# Altium project MVP-Dash-v1.0.PrjPcb (part 12 of 15)

## Sheet Type-C-Sheet.SchDoc
size 420 x 297 mm; SheetNumber: 22; SheetTotal: 25
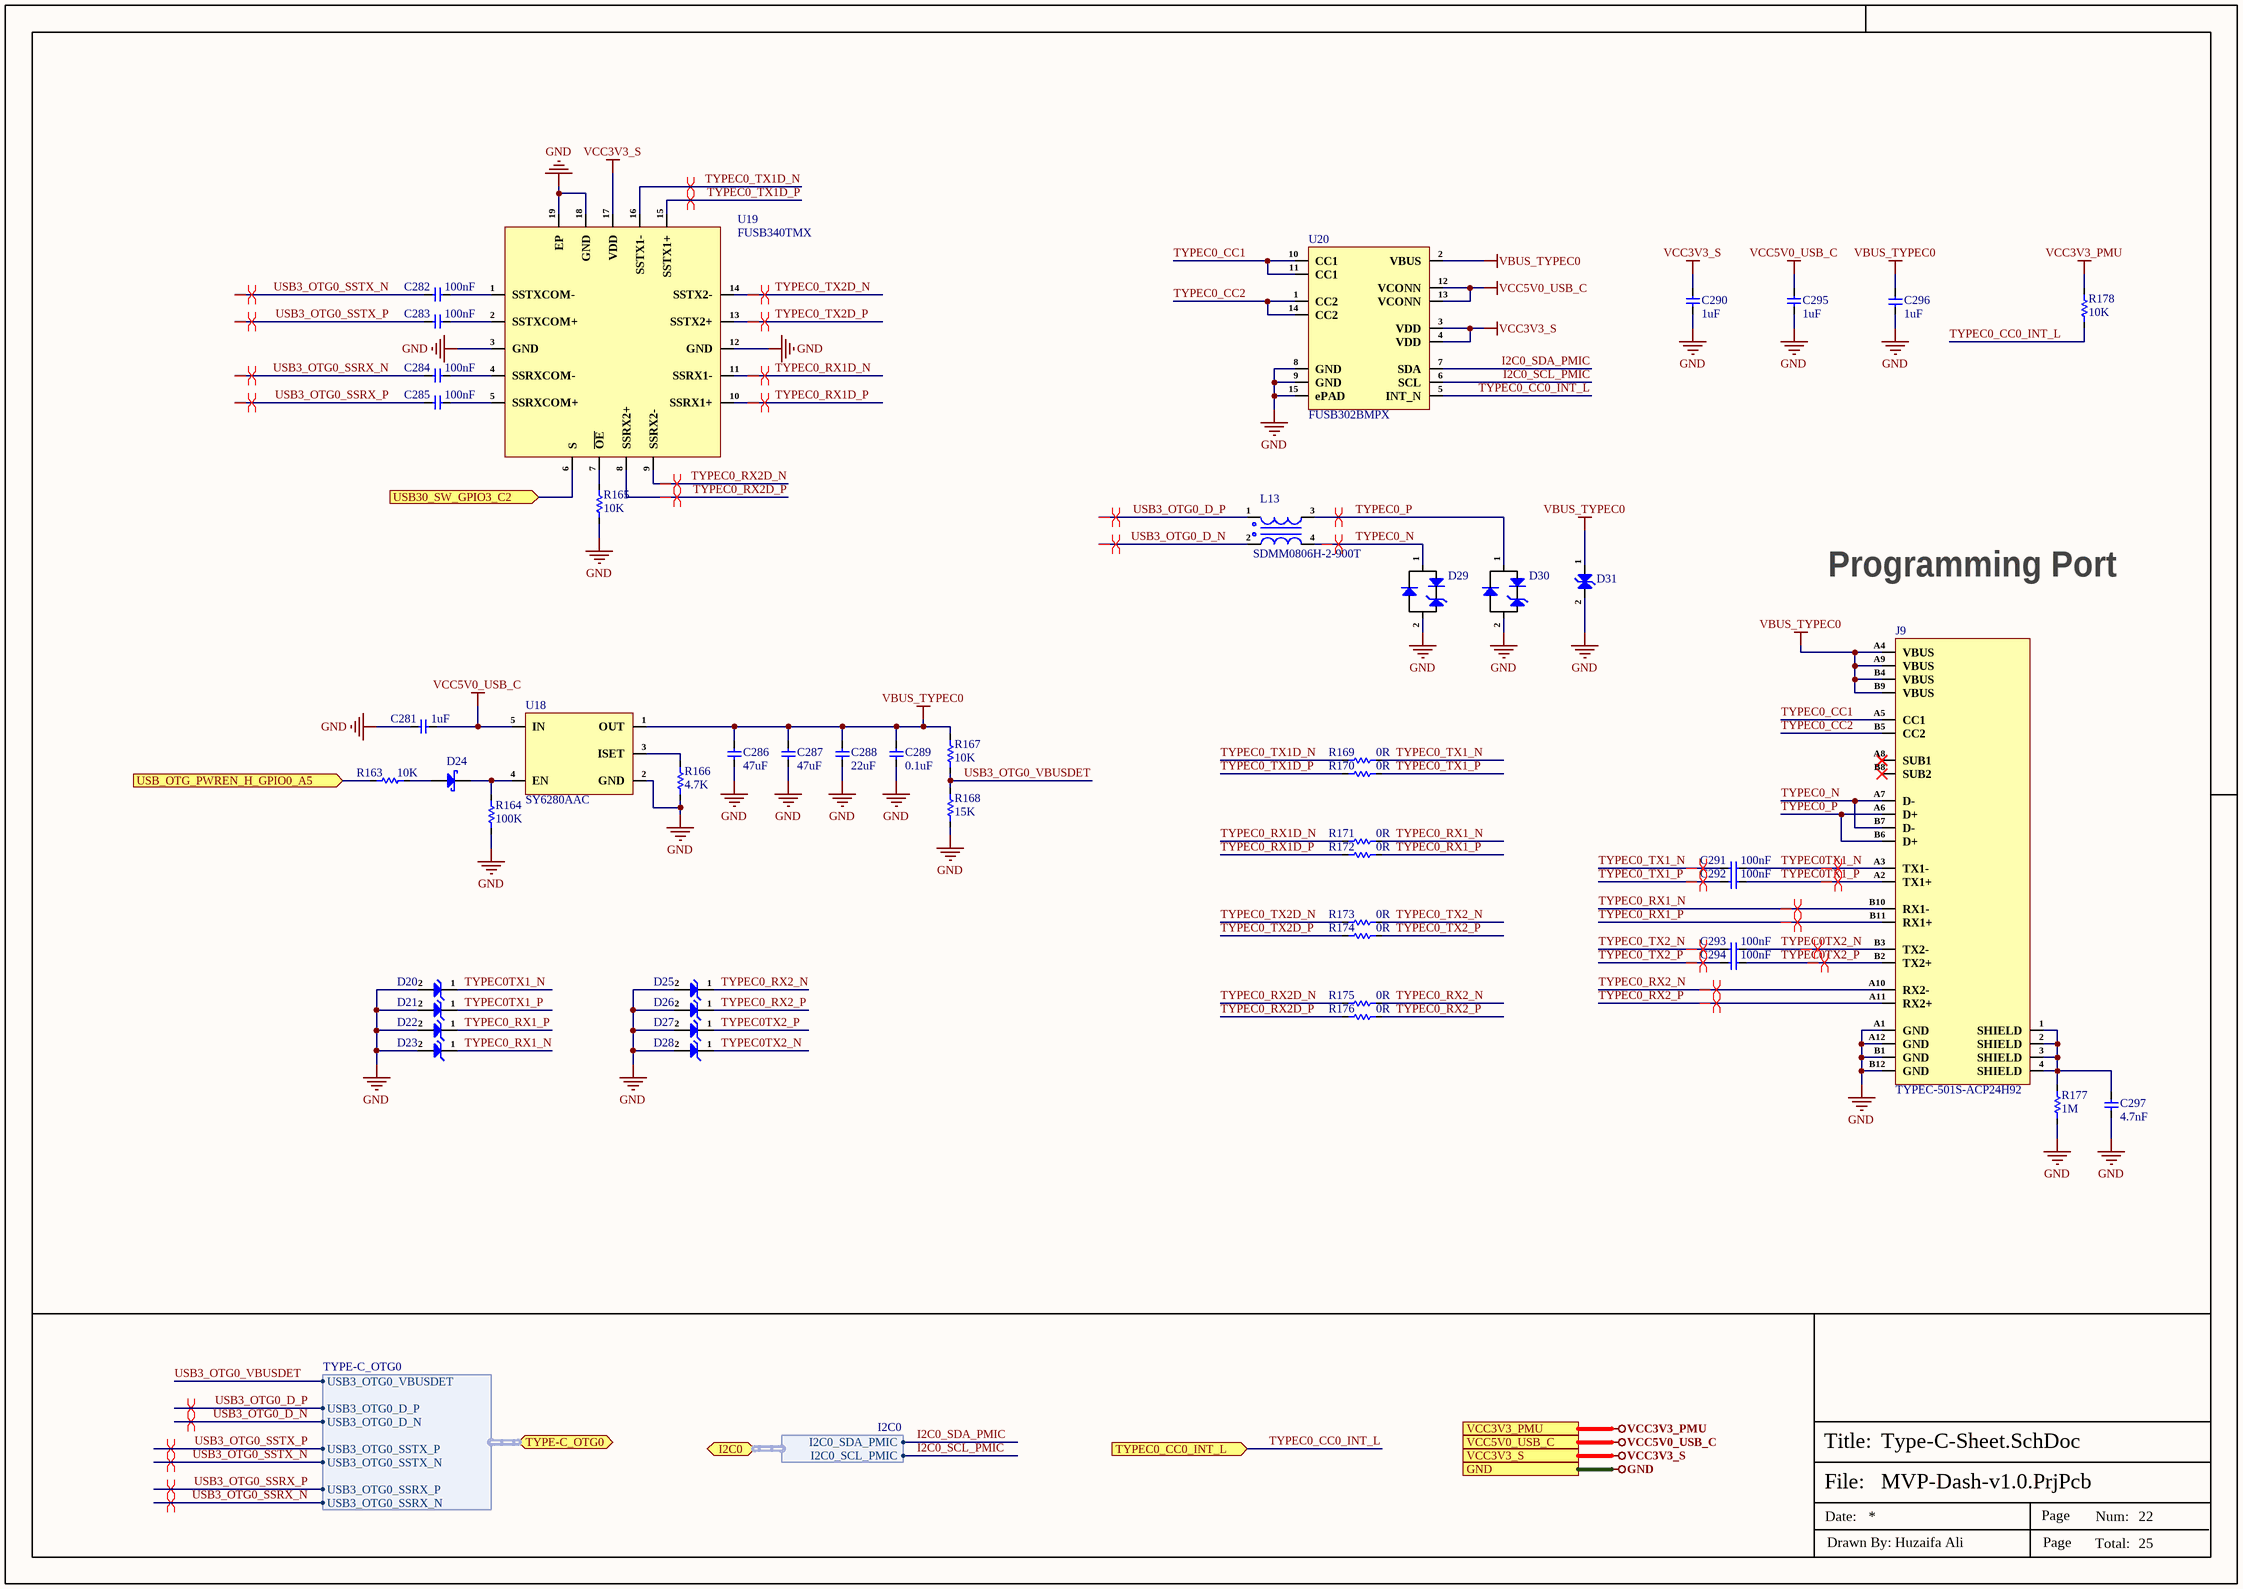
[diagram p29: Type-C-Sheet.SchDoc]

### Parts
C281  1uF  [Cap-0402]
C282  100nF  [CAP-0201]
C283  100nF  [CAP-0201]
C284  100nF  [CAP-0201]
C285  100nF  [CAP-0201]
C286  47uF  [Cap-1206]
C287  47uF  [Cap-1206]
C288  22uF  [Cap-0603]
C289  0.1uF  [Cap-0402]
C290  1uF  [Cap-0402]
C291  100nF  [CAP-0201]
C292  100nF  [CAP-0201]
C293  100nF  [CAP-0201]
C294  100nF  [CAP-0201]
C295  1uF  [Cap-0402]
C296  1uF  [Cap-0603]
C297  4.7nF  [Cap-1206]
D20  ESD5311Z-2/TR  [DFN0603-D]  (value not drawn)
D21  ESD5311Z-2/TR  [DFN0603-D]  (value not drawn)
D22  ESD5311Z-2/TR  [DFN0603-D]  (value not drawn)
D23  ESD5311Z-2/TR  [DFN0603-D]  (value not drawn)
D24  1N5819HW-7-F  [SOD-123]  (value not drawn)
D25  ESD5311Z-2/TR  [DFN0603-D]  (value not drawn)
D26  ESD5311Z-2/TR  [DFN0603-D]  (value not drawn)
D27  ESD5311Z-2/TR  [DFN0603-D]  (value not drawn)
D28  ESD5311Z-2/TR  [DFN0603-D]  (value not drawn)
D29  ESD5341N-2/TR  [DFN1006-2L_]  (value not drawn)
D30  ESD5341N-2/TR  [DFN1006-2L_]  (value not drawn)
D31  ESD5451N  [DFN1006-2L (Bi-Directional)]  (value not drawn)
J9  TYPEC-501S-ACP24H92  [TYPEC-501S-ACP24H92]
L13  SDMM0806H-2-900T  [0302]
R163  10K  [Res-0402]
R164  100K  [Res-0402]
R165  10K  [Res-0402]
R166  4.7K  [Res-0402]
R167  10K  [Res-0402]
R168  15K  [Res-0402]
R169  0R  [Res-0201]
R170  0R  [Res-0201]
R171  0R  [Res-0201]
R172  0R  [Res-0201]
R173  0R  [Res-0201]
R174  0R  [Res-0201]
R175  0R  [Res-0201]
R176  0R  [Res-0201]
R177  1M  [Res-0603]
R178  10K  [Res-0402]
U18  SY6280AAC  [SOT-23-5]
U19  FUSB340TMX  [X2-QFN-18]
U20  FUSB302BMPX  [WFQFN-14(2.5x2.5)]

### Ports
GND (see CAN-Bus-SPI-Flash-Sheet[4D], Connector-Sheet[5D], DRAM-LPDDR4x-Sheet[4D], eMMC-Sheet[4D], LED-Debug-Sheet[4D], Power-DC-IN-Sheet[4D], Power-Others-Sheet[4D], Power-PMIC-Sheet[4D], RK3568-Audio-Interface[4D], RK3568-Flash-SD-Controller[4D], RK3568-OSC-PMUIO-Sheet[5D], RK3568-Power-Sheet[4D], RK3568-SARADC-GPIO[4D], RK3568-USB-PCIe-Sheet[5D], RK3568-VI-Interface-Sheet[4D], RK3568-VO-Interface-1[4D], RK3568-VO-Interface-2[4D], Sensors-Sheet-1[4D], Sensors-Sheet-2[5D], USB-Ports[4D], VO-HDMI2.0-TX-Sheet[4D], VO-LCM-MIPI-DSI-TX0[4D], WIFI-BT-SDIO-Sheet[4D]), I2C0 (bidir, harness I2C0, see Power-Others-Sheet[3D], Power-PMIC-Sheet[2D], RK3568-OSC-PMUIO-Sheet[3D]), TYPE-C_OTG0 (bidir, harness TYPE-C_OTG0, see RK3568-USB-PCIe-Sheet[2D]), TYPEC0_CC0_INT_L (in, see RK3568-OSC-PMUIO-Sheet[5B]), USB30_SW_GPIO3_C2 (in, see RK3568-VO-Interface-2[3C]), USB_OTG_PWREN_H_GPIO0_A5 (in, see RK3568-OSC-PMUIO-Sheet[5B]), VCC3V3_PMU (see Power-Others-Sheet[4D], Power-PMIC-Sheet[4D], RK3568-OSC-PMUIO-Sheet[5D]), VCC3V3_S (see LED-Debug-Sheet[4D], Power-DC-IN-Sheet[4D], Sensors-Sheet-1[4D], Sensors-Sheet-2[5D], VO-LCM-MIPI-DSI-TX0[4D], WIFI-BT-SDIO-Sheet[4D]), VCC5V0_USB_C (see Power-DC-IN-Sheet[4D])

### Harnesses
TYPE-C_OTG0: USB3_OTG0_D_P, USB3_OTG0_D_N, USB3_OTG0_VBUSDET, USB3_OTG0_SSTX_P, USB3_OTG0_SSTX_N, USB3_OTG0_SSRX_P, USB3_OTG0_SSRX_N
I2C0: I2C0_SDA_PMIC, I2C0_SCL_PMIC

### Nets
GND: C281.1 C286.1 C287.1 C288.1 C289.1 C290.2 C295.2 C296.1 C297.1 D20.2(A) D21.2(A) D22.2(A) D23.2(A) D25.2(A) D26.2(A) D27.2(A) D28.2(A) D29.2(A) D30.2(A) D31.2(K) J9.A1(GND) J9.A12(GND) J9.B1(GND) J9.B12(GND) R164.2 R165.1 R166.1 R168.1 R177.1 U18.2(GND) U19.3(GND) U19.12(GND) U19.18(GND) U19.19(EP) U20.8(GND) U20.9(GND) U20.15(ePAD) ; port GND
VBUS_TYPEC0: C286.2 C287.2 C288.2 C289.2 C296.2 D31.1(K) J9.A4(VBUS) J9.A9(VBUS) J9.B4(VBUS) J9.B9(VBUS) R167.1 U18.1(OUT) U20.2(VBUS)
VCC3V3_PMU: R178.2 ; port VCC3V3_PMU
VCC3V3_S: C290.1 U19.17(VDD) U20.3(VDD) U20.4(VDD) ; port VCC3V3_S
VCC5V0_USB_C: C281.2 C295.1 U18.5(IN) U20.12(VCONN) U20.13(VCONN) ; port VCC5V0_USB_C
I2C0_SCL_PMIC: U20.6(SCL) ; port I2C0.I2C0_SCL_PMIC
I2C0_SDA_PMIC: U20.7(SDA) ; port I2C0.I2C0_SDA_PMIC
TYPEC0_CC0_INT_L: R178.1 U20.5(INT_N) ; port TYPEC0_CC0_INT_L
TYPEC0_CC1: J9.A5(CC1) U20.10(CC1) U20.11(CC1)
TYPEC0_CC2: J9.B5(CC2) U20.1(CC2) U20.14(CC2)
TYPEC0_N: D29.1(K) J9.A7(D-) J9.B7(D-) L13.4
TYPEC0_P: D30.1(K) J9.A6(D+) J9.B6(D+) L13.3
TYPEC0_RX1_N: D23.1(K) J9.B10(RX1-) R171.2
TYPEC0_RX1_P: D22.1(K) J9.B11(RX1+) R172.2
TYPEC0_RX1D_N: R171.1 U19.11(SSRX1-)
TYPEC0_RX1D_P: R172.1 U19.10(SSRX1+)
TYPEC0_RX2_N: D25.1(K) J9.A10(RX2-) R175.2
TYPEC0_RX2_P: D26.1(K) J9.A11(RX2+) R176.2
TYPEC0_RX2D_N: R175.1 U19.9(SSRX2-)
TYPEC0_RX2D_P: R176.1 U19.8(SSRX2+)
TYPEC0_TX1_N: C291.2 R169.2
TYPEC0_TX1_P: C292.2 R170.2
TYPEC0_TX1D_N: R169.1 U19.16(SSTX1-)
TYPEC0_TX1D_P: R170.1 U19.15(SSTX1+)
TYPEC0_TX2_N: C293.2 R173.2
TYPEC0_TX2_P: C294.2 R174.2
TYPEC0_TX2D_N: R173.1 U19.14(SSTX2-)
TYPEC0_TX2D_P: R174.1 U19.13(SSTX2+)
TYPEC0TX1_N: C291.1 D20.1(K) J9.A3(TX1-)
TYPEC0TX1_P: C292.1 D21.1(K) J9.A2(TX1+)
TYPEC0TX2_N: C293.1 D28.1(K) J9.B3(TX2-)
TYPEC0TX2_P: C294.1 D27.1(K) J9.B2(TX2+)
USB3_OTG0_D_N: L13.2 ; port TYPE-C_OTG0.USB3_OTG0_D_N
USB3_OTG0_D_P: L13.1 ; port TYPE-C_OTG0.USB3_OTG0_D_P
USB3_OTG0_SSRX_N: C284.2 ; port TYPE-C_OTG0.USB3_OTG0_SSRX_N
USB3_OTG0_SSRX_P: C285.2 ; port TYPE-C_OTG0.USB3_OTG0_SSRX_P
USB3_OTG0_SSTX_N: C282.2 ; port TYPE-C_OTG0.USB3_OTG0_SSTX_N
USB3_OTG0_SSTX_P: C283.2 ; port TYPE-C_OTG0.USB3_OTG0_SSTX_P
USB3_OTG0_VBUSDET: R167.2 R168.2 ; port TYPE-C_OTG0.USB3_OTG0_VBUSDET
NetC282_1: C282.1 U19.1(SSTXCOM-)
NetC283_1: C283.1 U19.2(SSTXCOM+)
NetC284_1: C284.1 U19.4(SSRXCOM-)
NetC285_1: C285.1 U19.5(SSRXCOM+)
NetC297_2: C297.2 J9.1(SHIELD) J9.2(SHIELD) J9.3(SHIELD) J9.4(SHIELD) R177.2
NetD24_1: D24.1(A) R163.1
NetD24_2: D24.2(K) R164.1 U18.4(EN)
NetR163_2: R163.2 ; port USB_OTG_PWREN_H_GPIO0_A5
NetR165_2: R165.2 U19.7(~{OE})
NetR166_2: R166.2 U18.3(ISET)
NetU8_AA7: U19.6(S) ; port USB30_SW_GPIO3_C2

Not connected (* = marked no-connect by the designer): J9 A8(SUB1)* B8(SUB2)*

### Layout directives
differential pair: TYPEC0_TX1D_N, TYPEC0_TX1D_P, USB3_OTG0_D_N, USB3_OTG0_D_P, USB3_OTG0_SSRX_N, USB3_OTG0_SSRX_P, USB3_OTG0_SSTX_N, USB3_OTG0_SSTX_P
differential pair; differential pair class USB: TYPEC0_N, TYPEC0_P, TYPEC0_RX1_N, TYPEC0_RX1_P, TYPEC0_RX1D_N, TYPEC0_RX1D_P, TYPEC0_RX2_N, TYPEC0_RX2_P, TYPEC0_RX2D_N, TYPEC0_RX2D_P, TYPEC0_TX1_N, TYPEC0_TX1_P, TYPEC0_TX2_N, TYPEC0_TX2_P, TYPEC0_TX2D_N, TYPEC0_TX2D_P, TYPEC0TX1_N, TYPEC0TX1_P, TYPEC0TX2_N, TYPEC0TX2_P, USB3_OTG0_D_N, USB3_OTG0_D_P, USB3_OTG0_SSRX_N, USB3_OTG0_SSRX_P, USB3_OTG0_SSTX_N, USB3_OTG0_SSTX_P

### Notes on the sheet
- Programming Port
- File:
- Title:
- Date:
- Page
- Num:
- Total:
- Drawn By: Huzaifa Ali

### Library data of the parts
C281 C290 C295 = CC0402KRX5R6BB105: CAP CER 1UF 10V X5R 0402; Manufacturer: Yageo; Tolerance: 10%; Dissipation Factor: 15%; Item Type: Capacitor; Supplier 1: Mouser; Manufacturer Part Number: CC0402KRX5R6BB105; RoHS: Yes; Category: Ceramic Capacitors; Stock 1: 6711367; Pricing 1: 1=0.11000, 10=0.05500, 50=0.05500, 100=0.03300, 500=0.02700, 1000=0.02200, 2500=0.02100, 10000=0.01800 (USD); Mount: Surface Mount; Case/Package: 0402; Number of Pins: 2; Case Code (Metric): 1005; Case Code (Imperial): 0402; Min Operating Temperature: -55°C; Max Operating Temperature: 85°C; Capacitance: 1uF; Dielectric: X5R; Package Quantity: 1; Voltage Rating: 10V; Packaging: Tape and Reel; Voltage Rating (DC): 10V; Termination: SMD/SMT; Resistor Type: Ceramic; Series: CC; Construction: Flat; Length: 1mm; Width: 0.02inch; Height: 0.5mm; Thickness: 0.022inch; Depth: 0.5mm; Radiation Hardening: No; REACH SVHC: No SVHC; Lead Free: Lead Free; Halogen Free: Halogen Free; RoHS Compliant: Yes; ComponentLink1URL: https://datasheet.ciiva.com/176/upy-gphc-x5r-4v-to-50v-12-176704.pdf?src-supplier=Digi-Key; ComponentLink1Description: https://datasheet.ciiva.com/176/upy-gphc-x5r-4v-to-50v-12-176704.pdf?src-supplier=Digi-Key; ComponentLink2URL: https://datasheet.ciiva.com/176/mlccorderingcode-176705.pdf?src-supplier=Digi-Key; ComponentLink2Description: https://datasheet.ciiva.com/176/mlccorderingcode-176705.pdf?src-supplier=Digi-Key; ComponentLink3URL: https://datasheet.ciiva.com/176/mlccorderingcode-176706.pdf?src-supplier=Digi-Key; ComponentLink3Description: https://datasheet.ciiva.com/176/mlccorderingcode-176706.pdf?src-supplier=Digi-Key; Supplier Part Number 1: 603-CC402KRX5R6BB105; LCSC Part Number: C106254
C282-C285 C291-C294 = CC0201KRX5R6BB104: CAP CER 0.1UF 10V X5R 0201; Manufacturer: Yageo; Tolerance: 10%; Supplier 1: Mouser; Manufacturer Part Number: CC0201KRX5R6BB104; RoHS: Yes; Category: Ceramic Capacitors; Stock 1: 824403; Pricing 1: 1=0.10000, 10=0.02400, 50=0.02400, 100=0.01900, 1000=0.01100, 10000=0.00900 (USD); Mount: Surface Mount; Case/Package: 0201; Case Code (Imperial): 0201; Case Code (Metric): 0603; Weight: 6E-06oz; Min Operating Temperature: -55°C; Max Operating Temperature: 85°C; Capacitance: 100nF; Dielectric: X5R; Voltage Rating (DC): 10V; Packaging: Tape and Reel; Termination: SMD/SMT; Resistor Type: Ceramic; Voltage Rating: 10V; Series: CC; Construction: Flat; Length: 0.6mm; Width: 0.012inch; Height: 0.3mm; Thickness: 0.013inch; Depth: 0.3mm; Radiation Hardening: No; Lead Free: Lead Free; Halogen Free: Halogen Free; RoHS Compliant: Yes; ComponentLink1URL: https://datasheet.ciiva.com/11587/upy-gphc-x5r-4v-to-50v-12-11587190.pdf?src-supplier=Avnet; ComponentLink1Description: https://datasheet.ciiva.com/11587/upy-gphc-x5r-4v-to-50v-12-11587190.pdf?src-supplier=Avnet; Supplier Part Number 1: 603-CC201KRX5R6BB104; LCSC Part Number: C190183
C286 C287 = GRM31CR61E476ME44L: CAP CER 47UF 25V X5R 1206; Manufacturer: Murata; Tolerance: 20%; Item Type: Capacitor; Supplier 1: Digi-Key; Manufacturer Part Number: GRM31CR61E476ME44L; RoHS: Yes; Category: Ceramic Capacitors; Capacitance: 47uF; Voltage Rating (DC): 25V; Dielectric: X5R; Length: 3.2mm; Width: 1.6mm; Thickness: 1.6mm; ComponentLink1URL: https://search.murata.co.jp/Ceramy/image/img/A01X/partnumbering_e_01.pdf?src-supplier=Digi-Key; ComponentLink1Description: https://search.murata.co.jp/Ceramy/image/img/A01X/partnumbering_e_01.pdf?src-supplier=Digi-Key; Supplier Part Number 1: 490-16268-2-ND; LCSC Part Number: C403725
C288 = CC0603MRX5R6BB226: CAP CER 22UF 10V X5R 0603; Manufacturer: Yageo; Tolerance: 20%; Item Type: Capacitor; Supplier 1: Digi-Key; Manufacturer Part Number: CC0603MRX5R6BB226; RoHS: Yes; Category: Ceramic Capacitors; Stock 1: 19628; Pricing 1: 1=0.68000, 10=0.48000, 50=0.36300, 100=0.31610, 500=0.23416, 1000=0.19903 (USD); Mount: Surface Mount; Case/Package: 0603; Case Code (Metric): 1608; Case Code (Imperial): 0603; Weight: 7.1E-05oz; Min Operating Temperature: -55°C; Max Operating Temperature: 85°C; Packaging: Tape and Reel; Capacitance: 22uF; Voltage Rating: 10V; Dielectric: X5R; Termination: SMD/SMT; Voltage Rating (DC): 10V; Package Quantity: 4000; Length: 0.063inch; Width: 0.8mm; Height: 0.8mm; Thickness: 0.035inch; Lead Free: Lead Free; Halogen Free: Halogen Free; RoHS Compliant: Yes; ComponentLink1URL: http://www.mouser.com/ds/2/447/Yageo_UPY-GP_NP0_16V-to-50V_9-358835.pdf?src-supplier=Mouser; ComponentLink1Description: http://www.mouser.com/ds/2/447/Yageo_UPY-GP_NP0_16V-to-50V_9-358835.pdf?src-supplier=Mouser; ComponentLink2URL: http://www.yageo.com/documents/recent/UPY-GPHC_X5R_4V-to-50V_25.pdf?src-supplier=Digi-Key; ComponentLink2Description: http://www.yageo.com/documents/recent/UPY-GPHC_X5R_4V-to-50V_25.pdf?src-supplier=Digi-Key; Supplier Part Number 1: 311-1819-1-ND; LCSC Part Number: C109447
C289 = CC0402KRX5R6BB104: CAP CER 0.1UF 10V X5R 0402; Manufacturer: Yageo; Capacitance: 100nF; Tolerance: 10%; Dissipation Factor: 5%; Insulation Resistance: 10GR; Item Type: Capacitor; Supplier 1: Digi-Key; Manufacturer Part Number: CC0402KRX5R6BB104; RoHS: Yes; Category: Ceramic Capacitors; Stock 1: 6385580; Pricing 1: 1=0.10000, 10=0.02700, 50=0.01500, 100=0.01220, 500=0.00874, 1000=0.00687, 2500=0.00625, 5000=0.00575 (USD); Mount: Surface Mount; Case/Package: 0402; Number of Pins: 2; Case Code (Imperial): 0402; Case Code (Metric): 1005; Min Operating Temperature: -55°C; Max Operating Temperature: 85°C; Dielectric: X5R; Packaging: Tape and Reel; Voltage Rating: 10V; Package Quantity: 1; Termination: SMD/SMT; Voltage Rating (DC): 10V; Series: CC; Length: 1mm; Width: 0.02inch; Height: 0.5mm; Depth: 0.5mm; Thickness: 0.022inch; Radiation Hardening: No; RoHS Compliant: Yes; REACH SVHC: No SVHC; Lead Free: Lead Free; Halogen Free: Halogen Free; ComponentLink1URL: https://datasheet.ciiva.com/144/mlccorderingcode-144029.pdf?src-supplier=Digi-Key; ComponentLink1Description: https://datasheet.ciiva.com/144/mlccorderingcode-144029.pdf?src-supplier=Digi-Key; ComponentLink2URL: https://datasheet.ciiva.com/144/mlccorderingcode-144028.pdf?src-supplier=Digi-Key; ComponentLink2Description: https://datasheet.ciiva.com/144/mlccorderingcode-144028.pdf?src-supplier=Digi-Key; ComponentLink3URL: https://datasheet.ciiva.com/144/mlccorderingcode-144030.pdf?src-supplier=Digi-Key; ComponentLink3Description: https://datasheet.ciiva.com/144/mlccorderingcode-144030.pdf?src-supplier=Digi-Key; ComponentLink4URL: https://datasheet.ciiva.com/7978/1359354-7978091.pdf?src-supplier=Element14; ComponentLink4Description: https://datasheet.ciiva.com/7978/1359354-7978091.pdf?src-supplier=Element14; ComponentLink5URL: https://datasheet.ciiva.com/11587/upy-gphc-x5r-4v-to-50v-12-11587302.pdf?src-supplier=Avnet; ComponentLink5Description: https://datasheet.ciiva.com/11587/upy-gphc-x5r-4v-to-50v-12-11587302.pdf?src-supplier=Avnet; Supplier Part Number 1: 311-1336-1-ND; LCSC Part Number: C129131
C296 = CL10A105KB8NNNC: CAP CER 1UF 50V X5R 0603; Manufacturer: Samsung; Material: 4241ConductorMaterial; Tolerance: 10%; Item Type: Capacitor; Supplier: Avnet; Supplier Part Number: CL10A105KB8NNNC; Manufacturer Part Number: CL10A105KB8NNNC; RoHS: Yes; Category: Ceramic Capacitors; Stock: 780446; Pricing: 4000=0.01632, 8000=0.01595, 16000=0.01557, 24000=0.0152, 32000=0.01482 (USD); Mounting Technology: Surface Mount; Case/Package: 0603; Case Code (Metric): 1608; Case Code (Imperial): 0603; Min Operating Temperature: -55°C; Max Operating Temperature: 85°C; Packaging: Tape and Reel; Value: 1uF; Voltage Rating: 50V; Dielectric: X5R; Series: CL; Voltage Rating (DC): 50V; Length: 1.6mm; Depth: 0.8mm; Radiation Hardening: No; RoHS Compliant: Yes; ComponentLink1URL: https://datasheet.ciiva.com/26877/getdatasheetpartid-753736-26877879.pdf?src-supplier=Verical; ComponentLink1Description: https://datasheet.ciiva.com/26877/getdatasheetpartid-753736-26877879.pdf?src-supplier=Verical; LCSC Part Number: C15849
C297 = CC1206KKX7RCBB472: CAP CER 4700PF 1KV X7R 1206; Manufacturer: Yageo; Dielectric Material: Ceramic; Tolerance: 10%; Item Type: Capacitor; Supplier 1: Future Electronics; Manufacturer Part Number: CC1206KKX7RCBB472; RoHS: Yes; Category: Ceramic Capacitors; Stock 1: 180000; Pricing 1: 3000=0.02860, 9000=0.02750, 15000=0.02700, 45000=0.02600, 75000=0.02510 (USD); Mount: Surface Mount; Case/Package: 1206; Number of Pins: 2; Case Code (Imperial): 1206; Case Code (Metric): 3216; Weight: 0.000571oz; Min Operating Temperature: -55°C; Max Operating Temperature: 125°C; Voltage Rating: 1kV; Capacitance: 4.7nF; Packaging: Tape and Reel; Voltage Rating (DC): 1kV; Dielectric: X7R; Termination: SMD/SMT; Resistor Type: Ceramic; Series: CC; Length: 3.2mm; Width: 0.063inch; Thickness: 0.057inch; Depth: 1.6mm; Radiation Hardening: No; Lead Free: Lead Free; RoHS Compliant: Yes; ComponentLink1URL: https://datasheet.ciiva.com/13208/upy-gp-np0-16v-to-50v-8-13208693.pdf?src-supplier=Mouser; ComponentLink1Description: https://datasheet.ciiva.com/13208/upy-gp-np0-16v-to-50v-8-13208693.pdf?src-supplier=Mouser; ComponentLink2URL: https://datasheet.ciiva.com/11466/hv-11466701.pdf?src-supplier=Avnet; ComponentLink2Description: https://datasheet.ciiva.com/11466/hv-11466701.pdf?src-supplier=Avnet; Supplier Part Number 1: 7130131; LCSC Part Number: C107198
D20-D23 D25-D28 = ESD5311Z-2/TR: DFN0603-D ESD Protection Devices ROHS; Manufacturer: WILLSEMI; Item Type: Diode; Manufacturer Part Number: ESD5311Z-2/TR; Package: DFN0603-D; LCSC Part Number: C239819; ComponentLink1Description: LCSC; ComponentLink1URL: https://www.lcsc.com/product-detail/ESD-Protection-Devices_WILLSEMI-Will-Semicon-ESD5311Z-2-TR_C239819.html
D24 = 1N5819HW-7-F: DIODE SCHOTTKY 40V 1A SOD123; Manufacturer: Diodes; Forward Voltage: 450mV; Max Reverse Current: 50uA; Element Configuration: Single; Max Forward Surge Current (Ifsm): 25A; Max Power Dissipation: 450mW; Polarity: Standard; Capacitance: 110pF; Supplier 1: Digi-Key; Manufacturer Part Number: 1N5819HW-7-F; RoHS: Yes; Category: Schottky Diodes; Pricing 1: 1=0.46000, 10=0.34500, 100=0.19530, 500=0.12936, 1000=0.09918 (USD); Case/Package: SOD-123-2; Number of Pins: 2; Weight: 0.000353oz; Contact Plating: Tin,Matte; Min Operating Temperature: -65°C; Max Operating Temperature: 125°C; Forward Current: 1A; Max Repetitive Reverse Voltage (Vrrm): 40V; Packaging: Tape and Reel; Peak Non-Repetitive Surge Current: 25A; Package Quantity: 3000; Average Rectified Current: 1A; Termination: SMD/SMT; Voltage Rating (DC): 40V; Current Rating: 1A; Output Current: 1A; Max Reverse Voltage (DC): 40V; Series: -; Length: 2.85mm; Width: 1.7mm; Height: 1.25mm; Radiation Hardening: No; RoHS Compliant: Yes; REACH SVHC: No SVHC; Lead Free: Lead Free; ComponentLink1URL: https://datasheet.ciiva.com/16303/ds30217-16303296.pdf?src-supplier=Future+Electronics; ComponentLink1Description: https://datasheet.ciiva.com/16303/ds30217-16303296.pdf?src-supplier=Future+Electronics; ComponentLink2URL: https://datasheet.ciiva.com/27092/1538419-27092484.pdf?src-supplier=Jameco; ComponentLink2Description: https://datasheet.ciiva.com/27092/1538419-27092484.pdf?src-supplier=Jameco; ComponentLink3URL: https://datasheet.ciiva.com/912/ds30217-912801.pdf?src-supplier=Digi-Key; ComponentLink3Description: https://datasheet.ciiva.com/912/ds30217-912801.pdf?src-supplier=Digi-Key; ComponentLink4URL: https://datasheet.ciiva.com/1177/ds30217-1177089.pdf?src-supplier=Element14; ComponentLink4Description: https://datasheet.ciiva.com/1177/ds30217-1177089.pdf?src-supplier=Element14; ComponentLink5URL: https://datasheet.ciiva.com/912/ds30217-912802.pdf?src-supplier=Digi-Key; ComponentLink5Description: https://datasheet.ciiva.com/912/ds30217-912802.pdf?src-supplier=Digi-Key; ComponentLink6URL: https://datasheet.ciiva.com/912/ds30217-912803.pdf?src-supplier=Digi-Key; ComponentLink6Description: https://datasheet.ciiva.com/912/ds30217-912803.pdf?src-supplier=Digi-Key; ComponentLink7URL: https://datasheet.ciiva.com/8303/ds30217-8303132.pdf?src-supplier=Avnet; ComponentLink7Description: https://datasheet.ciiva.com/8303/ds30217-8303132.pdf?src-supplier=Avnet; ComponentLink8URL: https://datasheet.ciiva.com/25919/ds30217-25919644.pdf?src-supplier=Avnet+Europe; ComponentLink8Description: https://datasheet.ciiva.com/25919/ds30217-25919644.pdf?src-supplier=Avnet+Europe; Supplier Part Number 1: 1N5819HW-FDICT-ND; LCSC Part Number: C82544; Item Type: Diode
D29 D30 = ESD5341N-2/TR: 4A@8/20us 15V 7V 5V Unidirectional DFN1006-2L TVS ROHS; Manufacturer: WILLSEMI; Item Type: Diode; Manufacturer Part Number: ESD5341N-2/TR; Package: DFN1006-2L; ComponentLink1Description: LCSC; ComponentLink1URL: https://www.lcsc.com/product-detail/TVS_WILLSEMI-Will-Semicon-ESD5341N-2-TR_C239773.html; LCSC Part Number: C239773
D31 = ESD5451N: DFN1006-2(0402) ESD Protection Devices ROHS; Manufacturer: TECH PUBLIC; Manufacturer Part Number: ESD5451N; Footprint: DFN1006-2(0402); ComponentLink1Description: LCSC; ComponentLink1URL: https://www.lcsc.com/product-detail/span-style-background-color-ff0-ESD-span-Protection-Devices_TECH-PUBLIC-ESD5451N_C2936977.html; LCSC Part Number: C2936977
J9 = TYPEC-501S-ACP24H92: 5A USB 3.1 1 260℃ Brick nogging 24P Female -45℃~+85℃ Type-C SMD USB Connectors ROHS; Manufacturer: XUNPU; Manufacturer Part Number: TYPEC-501S-ACP24H92; Package: SMD; LCSC Part Number: C2840394; Item Type: Type-C SMD USB Connector; ComponentLink1Description: LCSC; ComponentLink1URL: https://www.lcsc.com/product-detail/USB-Connectors_XUNPU-TYPEC-501S-ACP24H92_C2840394.html
L13 = SDMM0806H-2-900T: 90Ω@100MHz 4Ω 2 0302 Common Mode Filters ROHS; Manufacturer: Sunlord; Manufacturer Part Number: SDMM0806H-2-900T; Package: 0302; LCSC Part Number: C370285; Item Type: Common Mode Filter; ComponentLink1Description: LCSC; ComponentLink1URL: https://www.lcsc.com/product-detail/Common-Mode-Filters_Sunlord-SDMM0806H-2-900T_C370285.html
R163 R165 R167 R178 = RC0402FR-0710KL: RES 10K OHM 1% 1/16W 0402; Manufacturer: Yageo; Resistance: 10kR; Voltage Rating (DC): 50V; Temperature Coefficient: 100ppm/°C; Power Rating: 62.5mW; Max Power Dissipation: 63mW; Item Type: Resistor; Supplier 1: Mouser; Manufacturer Part Number: RC0402FR-0710KL; RoHS: Yes; Category: Chip SMD Resistors; Stock 1: 18648329; Pricing 1: 1=0.10000, 10=0.01400, 50=0.01400, 100=0.00500, 1000=0.00300, 10000=0.00200 (USD); Case/Package: 0402; Number of Pins: 2; Case Code (Imperial): 0402; Case Code (Metric): 1005; Min Operating Temperature: -55°C; Max Operating Temperature: 155°C; Resistor Type: Thick Film; Tolerance: 1%; Packaging: Tape and Reel; Voltage Rating: 50V; Termination: SMD/SMT; Working Voltage: 50V; Number of Terminations: 2; Features: Moisture Resistant; Series: RC; Resistance Tolerance: 1%; Construction: Rectangular; Length: 1mm; Width: 0.5mm; Height: 0.32mm; Depth: 0.5mm; Lead Pitch: 0.2mm; REACH SVHC: No SVHC; Lead Free: Lead Free; RoHS Compliant: Yes; Military Standard: Not; ComponentLink1URL: https://datasheet.ciiva.com/7660/38568-7660787.pdf?src-supplier=Element14; ComponentLink1Description: https://datasheet.ciiva.com/7660/38568-7660787.pdf?src-supplier=Element14; ComponentLink2URL: https://datasheet.ciiva.com/7849/1686128-7849814.pdf?src-supplier=Element14; ComponentLink2Description: https://datasheet.ciiva.com/7849/1686128-7849814.pdf?src-supplier=Element14; ComponentLink3URL: https://datasheet.ciiva.com/7983/1018594-7983486.pdf?src-supplier=Element14; ComponentLink3Description: https://datasheet.ciiva.com/7983/1018594-7983486.pdf?src-supplier=Element14; ComponentLink4URL: https://datasheet.ciiva.com/22747/1018594-22747512.pdf?src-supplier=Element14; ComponentLink4Description: https://datasheet.ciiva.com/22747/1018594-22747512.pdf?src-supplier=Element14; ComponentLink5URL: https://datasheet.ciiva.com/12667/pyu-rc0402-51-rohs-l-6-r-12667067.pdf?src-supplier=Mouser; ComponentLink5Description: https://datasheet.ciiva.com/12667/pyu-rc0402-51-rohs-l-6-r-12667067.pdf?src-supplier=Mouser; ComponentLink6URL: https://datasheet.ciiva.com/7849/1784430-7849813.pdf?src-supplier=Element14; ComponentLink6Description: https://datasheet.ciiva.com/7849/1784430-7849813.pdf?src-supplier=Element14; ComponentLink7URL: https://datasheet.ciiva.com/7849/1784430-7849815.pdf?src-supplier=Element14; ComponentLink7Description: https://datasheet.ciiva.com/7849/1784430-7849815.pdf?src-supplier=Element14; Supplier Part Number 1: 603-RC0402FR-0710KL; LCSC Part Number: C60490
R164 = RC0402FR-07100KL: RES 100K OHM 1% 1/16W 0402; Manufacturer: Yageo; Resistance: 100kR; Temperature Coefficient: 100ppm/°C; Power Rating: 63mW; Voltage Rating: 50V; Item Type: Resistor; Supplier 1: Mouser; Manufacturer Part Number: RC0402FR-07100KL; RoHS: Yes; Category: Chip SMD Resistors; Stock 1: 7759549; Pricing 1: 1=0.10000, 10=0.01200, 50=0.01200, 100=0.00500, 1000=0.00300, 2500=0.00200, 10000=0.00100 (USD); Case/Package: 0402; Case Code (Metric): 1005; Case Code (Imperial): 0402; Min Operating Temperature: -55°C; Max Operating Temperature: 155°C; Resistor Type: Thick Film; Tolerance: 1%; Packaging: Tape and Reel; Package Quantity: 1; Number of Terminations: 2; Termination: SMD/SMT; Max Power Dissipation: 63mW; Working Voltage: 50V; Features: Moisture Resistant; Series: RC; Resistance Tolerance: 1%; Construction: Rectangular; Technology: THICK FILM; Length: 0.039inch; Width: 0.02inch; Height: 0.016inch; Depth: 0.5mm; REACH SVHC: No SVHC; Lead Free: Lead Free; RoHS Compliant: Yes; Military Standard: Not; ComponentLink1URL: https://datasheet.ciiva.com/11819/0900766b80c66297-11819452.pdf?src-supplier=RSComponents; ComponentLink1Description: https://datasheet.ciiva.com/11819/0900766b80c66297-11819452.pdf?src-supplier=RSComponents; ComponentLink2URL: https://datasheet.ciiva.com/22747/1018594-22747509.pdf?src-supplier=Element14; ComponentLink2Description: https://datasheet.ciiva.com/22747/1018594-22747509.pdf?src-supplier=Element14; ComponentLink3URL: https://datasheet.ciiva.com/2453/pyu-r-int-thick-7-2453362.pdf?src-supplier=Digi-Key; ComponentLink3Description: https://datasheet.ciiva.com/2453/pyu-r-int-thick-7-2453362.pdf?src-supplier=Digi-Key; ComponentLink4URL: https://datasheet.ciiva.com/2453/pyu-r-int-thick-7-2453363.pdf?src-supplier=Digi-Key; ComponentLink4Description: https://datasheet.ciiva.com/2453/pyu-r-int-thick-7-2453363.pdf?src-supplier=Digi-Key; ComponentLink5URL: https://datasheet.ciiva.com/2453/pyu-r-int-thick-7-2453361.pdf?src-supplier=Digi-Key; ComponentLink5Description: https://datasheet.ciiva.com/2453/pyu-r-int-thick-7-2453361.pdf?src-supplier=Digi-Key; ComponentLink6URL: https://datasheet.ciiva.com/12667/pyu-rc0402-51-rohs-l-6-r-12667930.pdf?src-supplier=Mouser; ComponentLink6Description: https://datasheet.ciiva.com/12667/pyu-rc0402-51-rohs-l-6-r-12667930.pdf?src-supplier=Mouser; ComponentLink7URL: https://datasheet.ciiva.com/15189/getdatasheetpartid-323696-15189334.pdf?src-supplier=Verical; ComponentLink7Description: https://datasheet.ciiva.com/15189/getdatasheetpartid-323696-15189334.pdf?src-supplier=Verical; Supplier Part Number 1: 603-RC0402FR-07100KL; LCSC Part Number: C60491
R166 = RC0402FR-074K7L: RES 4.7K OHM 1% 1/16W 0402; Manufacturer: Yageo; Voltage Rating (DC): 50V; Power Rating: 62.5mW; Resistance: 4.7kR; Temperature Coefficient: 100ppm/°C; Max Power Dissipation: 63mW; Item Type: Resistor; Supplier 1: Avnet; Manufacturer Part Number: RC0402FR-074K7L; RoHS: Yes; Category: Chip SMD Resistors; Stock 1: 2420000; Pricing 1: 10000=0.00085 (USD); Case/Package: 0402; Number of Pins: 2; Case Code (Imperial): 0402; Case Code (Metric): 1005; Size Code: 0402; Min Operating Temperature: -55°C; Max Operating Temperature: 155°C; Tolerance: 1%; Voltage Rating: 50V; Packaging: Tape and Reel; Resistor Type: Thick Film; Termination: SMD/SMT; Features: Moisture Resistant; Series: RC; Number of Terminations: 2; Resistance Tolerance: 1%; Construction: Rectangular; Length: 1mm; Width: 0.5mm; Height: 0.32mm; Depth: 0.5mm; Height - Seated (Max): 0.016inch; RoHS Compliant: Yes; Reach SVHC Compliant: Yes; Military Standard: Not; Lead Free: Lead Free; ComponentLink1URL: https://datasheet.ciiva.com/22661/1686128-22661342.pdf?src-supplier=Element14; ComponentLink1Description: https://datasheet.ciiva.com/22661/1686128-22661342.pdf?src-supplier=Element14; ComponentLink2URL: https://datasheet.ciiva.com/7850/1018594-7850022.pdf?src-supplier=Element14; ComponentLink2Description: https://datasheet.ciiva.com/7850/1018594-7850022.pdf?src-supplier=Element14; ComponentLink3URL: https://datasheet.ciiva.com/7850/1018594-7850023.pdf?src-supplier=Element14; ComponentLink3Description: https://datasheet.ciiva.com/7850/1018594-7850023.pdf?src-supplier=Element14; ComponentLink4URL: https://datasheet.ciiva.com/15215/getdatasheetpartid-328119-15215035.pdf?src-supplier=Verical; ComponentLink4Description: https://datasheet.ciiva.com/15215/getdatasheetpartid-328119-15215035.pdf?src-supplier=Verical; Supplier Part Number 1: RC0402FR-074K7L; LCSC Part Number: C105871
R168 = RT0402BRD0715KL: RES SMD 15K OHM 0.1% 1/16W 0402; Manufacturer: Yageo; Item Type: Resistor; Supplier: Arrow Electronics; Supplier Part Number: RT0402BRD0715KL; Manufacturer Part Number: RT0402BRD0715KL; RoHS: Yes; Category: Chip SMD Resistors; Stock: 10000; Pricing: 10000=0.0361, 30000=0.0357, 50000=0.0243, 100000=0.0205 (USD); ComponentLink1URL: https://datasheet.ciiva.com/12723/pyu-rt-1-to-0-05-rohs-l-4-12723782.pdf?src-supplier=Mouser; ComponentLink1Description: https://datasheet.ciiva.com/12723/pyu-rt-1-to-0-05-rohs-l-4-12723782.pdf?src-supplier=Mouser; ComponentLink2URL: https://datasheet.ciiva.com/2582/pyu-rt-1-to-0-05-rohs-l-5-2582151.pdf?src-supplier=Digi-Key; ComponentLink2Description: https://datasheet.ciiva.com/2582/pyu-rt-1-to-0-05-rohs-l-5-2582151.pdf?src-supplier=Digi-Key; LCSC Part Number: C852545
R169-R176 = RC0201JR-070RL: RES SMD 0 OHM JUMPER 1/20W 0201; Manufacturer: Yageo; Power Rating: 50mW; Tolerance: 5%; Voltage Rating: 25V; Supplier 1: Digi-Key; Manufacturer Part Number: RC0201JR-070RL; RoHS: Yes; Category: Chip SMD Resistors; Stock 1: 11079; Pricing 1: 1=0.10000, 10=0.03600, 25=0.02640, 50=0.02000, 100=0.01480, 250=0.01128, 500=0.00904, 1000=0.00665, 5000=0.00477 (USD); Case/Package: 0201; Contact Plating: Tin,Matte; Case Code (Metric): 0603; Case Code (Imperial): 0201; Weight: 6E-06oz; Size Code: 0201; Min Operating Temperature: -55°C; Max Operating Temperature: 125°C; Resistor Type: Thick Film; Resistance: 0R; Packaging: Tape and Reel; Package Quantity: 10000; Number of Terminations: 2; Termination: SMD/SMT; Max Power Dissipation: 50mW; Voltage Rating (DC): 25V; Features: Moisture Resistant; Series: RC; Construction: Rectangular; Resistance Tolerance: 5%; Length: 0.6mm; Width: 0.012inch; Height: 0.01inch; Depth: 0.3mm; Radiation Hardening: No; RoHS Compliant: Yes; REACH SVHC: Unknown; Military Standard: Not; Lead Free: Lead Free; ComponentLink1URL: https://datasheet.ciiva.com/7672/1563626-7672247.pdf?src-supplier=Element14; ComponentLink1Description: https://datasheet.ciiva.com/7672/1563626-7672247.pdf?src-supplier=Element14; ComponentLink2URL: https://datasheet.ciiva.com/7660/1421516-7660808.pdf?src-supplier=Element14; ComponentLink2Description: https://datasheet.ciiva.com/7660/1421516-7660808.pdf?src-supplier=Element14; ComponentLink3URL: https://datasheet.ciiva.com/7672/1563626-7672248.pdf?src-supplier=Element14; ComponentLink3Description: https://datasheet.ciiva.com/7672/1563626-7672248.pdf?src-supplier=Element14; ComponentLink4URL: https://datasheet.ciiva.com/16855/pyu-rc0201-51-rohs-l-8-16855994.pdf?src-supplier=Avnet+Europe; ComponentLink4Description: https://datasheet.ciiva.com/16855/pyu-rc0201-51-rohs-l-8-16855994.pdf?src-supplier=Avnet+Europe; ComponentLink5URL: https://datasheet.ciiva.com/28419/pyu-rc0201-51-rohs-l-8-28419660.pdf?src-supplier=Avnet+Europe; ComponentLink5Description: https://datasheet.ciiva.com/28419/pyu-rc0201-51-rohs-l-8-28419660.pdf?src-supplier=Avnet+Europe; ComponentLink6URL: https://datasheet.ciiva.com/46391/1421516-46391340.pdf?src-supplier=Element14; ComponentLink6Description: https://datasheet.ciiva.com/46391/1421516-46391340.pdf?src-supplier=Element14; ComponentLink7URL: https://datasheet.ciiva.com/8896/pyu-rc0201-51-rohs-l-8-8896143.pdf?src-supplier=Avnet; ComponentLink7Description: https://datasheet.ciiva.com/8896/pyu-rc0201-51-rohs-l-8-8896143.pdf?src-supplier=Avnet; Supplier Part Number 1: 311-0.0NCT-ND; LCSC Part Number: C106228
R177 = RC0603FR-071ML: RES SMD 1M OHM 1% 1/10W 0603; Manufacturer: Yageo; Voltage Rating: 50V; Resistance: 1MR; Power Rating: 100mW; Temperature Coefficient: 100ppm/°C; Item Type: Resistor; Supplier 1: Digi-Key; Manufacturer Part Number: RC0603FR-071ML; Stock 1: 3824601; Pricing 1: 1=0.1, 10=0.023, 100=0.0094, 1000=0.00421, 2500=0.00366 (USD); Case/Package: 0603; Number of Pins: 2; Case Code (Imperial): 0603; Case Code (Metric): 1608; Min Operating Temperature: -55°C; Max Operating Temperature: 155°C; Voltage Rating (DC): 50V; Tolerance: 1%; Packaging: Tape and Reel; Package Quantity: 5000; Termination: SMD/SMT; Composition: Thick Film; Military Standard: Not; Length: 1.6mm; Height: 0.45mm; Width: 0.8mm; Depth: 0.8mm; REACH SVHC: No SVHC; Lead Free: Lead Free; ComponentLink1URL: http://www.farnell.com/datasheets/2167052.pdf?src-supplier=Mouser; ComponentLink1Description: http://www.farnell.com/datasheets/2167052.pdf?src-supplier=Mouser; ComponentLink2URL: http://www.farnell.com/datasheets/2167052.pdf?src-supplier=Element14; ComponentLink2Description: http://www.farnell.com/datasheets/2167052.pdf?src-supplier=Element14; ComponentLink3URL: http://documents.rs-components.com/techlib://itc_doclist_GB.htm?stockno=5048956&src-supplier=RSComponents; ComponentLink3Description: http://documents.rs-components.com/techlib://itc_doclist_GB.htm?stockno=5048956&src-supplier=RSComponents; Supplier Part Number 1: 311-1.00MHRDKR-ND; LCSC Part Number: C105578
U18 = SY6280AAC: SOT-23-5 Power Distribution Switches ROHS; Manufacturer: Silergy; Item Type: IC; Supplier: Avnet; Supplier Part Number: SY6280AAC; Manufacturer Part Number: SY6280AAC; RoHS: No; Category: USB Interface ICs; Stock: 3000; LCSC Part Number: C55136
U19 = FUSB340TMX: IC USB TYPE C CTLR PROGR 18TMLP; Manufacturer: ON Semiconductor / Fairchild; Item Type: USB Interface ICs; Operating Supply Current: 12uA; Number of Switches: 4; Data Rate: 10Gbps; Max Supply Voltage: 5V; Min Supply Voltage: 1.5V; Supplier: Avnet; Supplier Part Number: FUSB340TMX; Manufacturer Part Number: FUSB340TMX; RoHS: Yes; Stock: 15000; Pricing: 1516=0.4884, 1600=0.4752, 3100=0.462, 7600=0.4488, 16000=0.4356, 76000=0.4224, 160000=0.4092 (USD); Mounting Technology: Surface Mount; Pins: 18; Weight: 0.0065g; Min Operating Temperature: -40°C; Max Operating Temperature: 85°C; Packaging: Cut Tape; Interface: USB; Series: -; Nominal Supply Current: 12uA; Height: 400um; RoHS Compliant: Yes; ComponentLink1URL: http://www.farnell.com/datasheets/2313412.pdf?src-supplier=Farnell; ComponentLink1Description: http://www.farnell.com/datasheets/2313412.pdf?src-supplier=Farnell; ComponentLink2URL: http://www.farnell.com/datasheets/2313412.pdf?src-supplier=Newark; ComponentLink2Description: http://www.farnell.com/datasheets/2313412.pdf?src-supplier=Newark; ComponentLink3URL: https://datasheet.octopart.com/FUSB340TMX-ON-Semiconductor-datasheet-85553255.pdf?src-supplier=Farnell; ComponentLink3Description: https://datasheet.octopart.com/FUSB340TMX-ON-Semiconductor-datasheet-85553255.pdf?src-supplier=Farnell; ComponentLink4URL: https://datasheet.octopart.com/FUSB340TMX-ON-Semiconductor-datasheet-46935021.pdf?src-supplier=Future+Electronics; ComponentLink4Description: https://datasheet.octopart.com/FUSB340TMX-ON-Semiconductor-datasheet-46935021.pdf?src-supplier=Future+Electronics; ComponentLink5URL: https://www.fairchildsemi.com/Assets/-Featured-Collateral/Datasheet-Briefs/FUSB340_PB_Final.pdf?src-supplier=Avnet; ComponentLink5Description: https://www.fairchildsemi.com/Assets/-Featured-Collateral/Datasheet-Briefs/FUSB340_PB_Final.pdf?src-supplier=Avnet; LCSC Part Number: C478457
U20 = FUSB302BMPX: IC USB TYPE C CTLR PROGR 14-MLP; Manufacturer: ON Semiconductor / Fairchild; Operating Supply Current: 25uA; USB Standard: 6111USBStandard; Data Rate: 5Gbps; Max Supply Voltage: 21V; Min Supply Voltage: 2.7V; Number of Ports: 1NUMBER; Supplier: Avnet; Supplier Part Number: FUSB302BMPX; Manufacturer Part Number: FUSB302BMPX; RoHS: Yes; Category: USB Interface ICs; Stock: 4000; Pricing: 1429=0.518, 1500=0.504, 2900=0.49, 7200=0.476, 15000=0.462, 72000=0.448, 150000=0.434 (USD); Mounting Technology: Surface Mount; Min Operating Temperature: -40°C; Max Operating Temperature: 125°C; Interface: USB; Packaging: Cut Tape; Series: -; Height: 800um; RoHS Compliant: Yes; LCSC Part Number: C132291; Item Type: IC

## Sheet Sensors-Sheet-1.SchDoc
size 420 x 297 mm; SheetNumber: 22; SheetTotal: 24
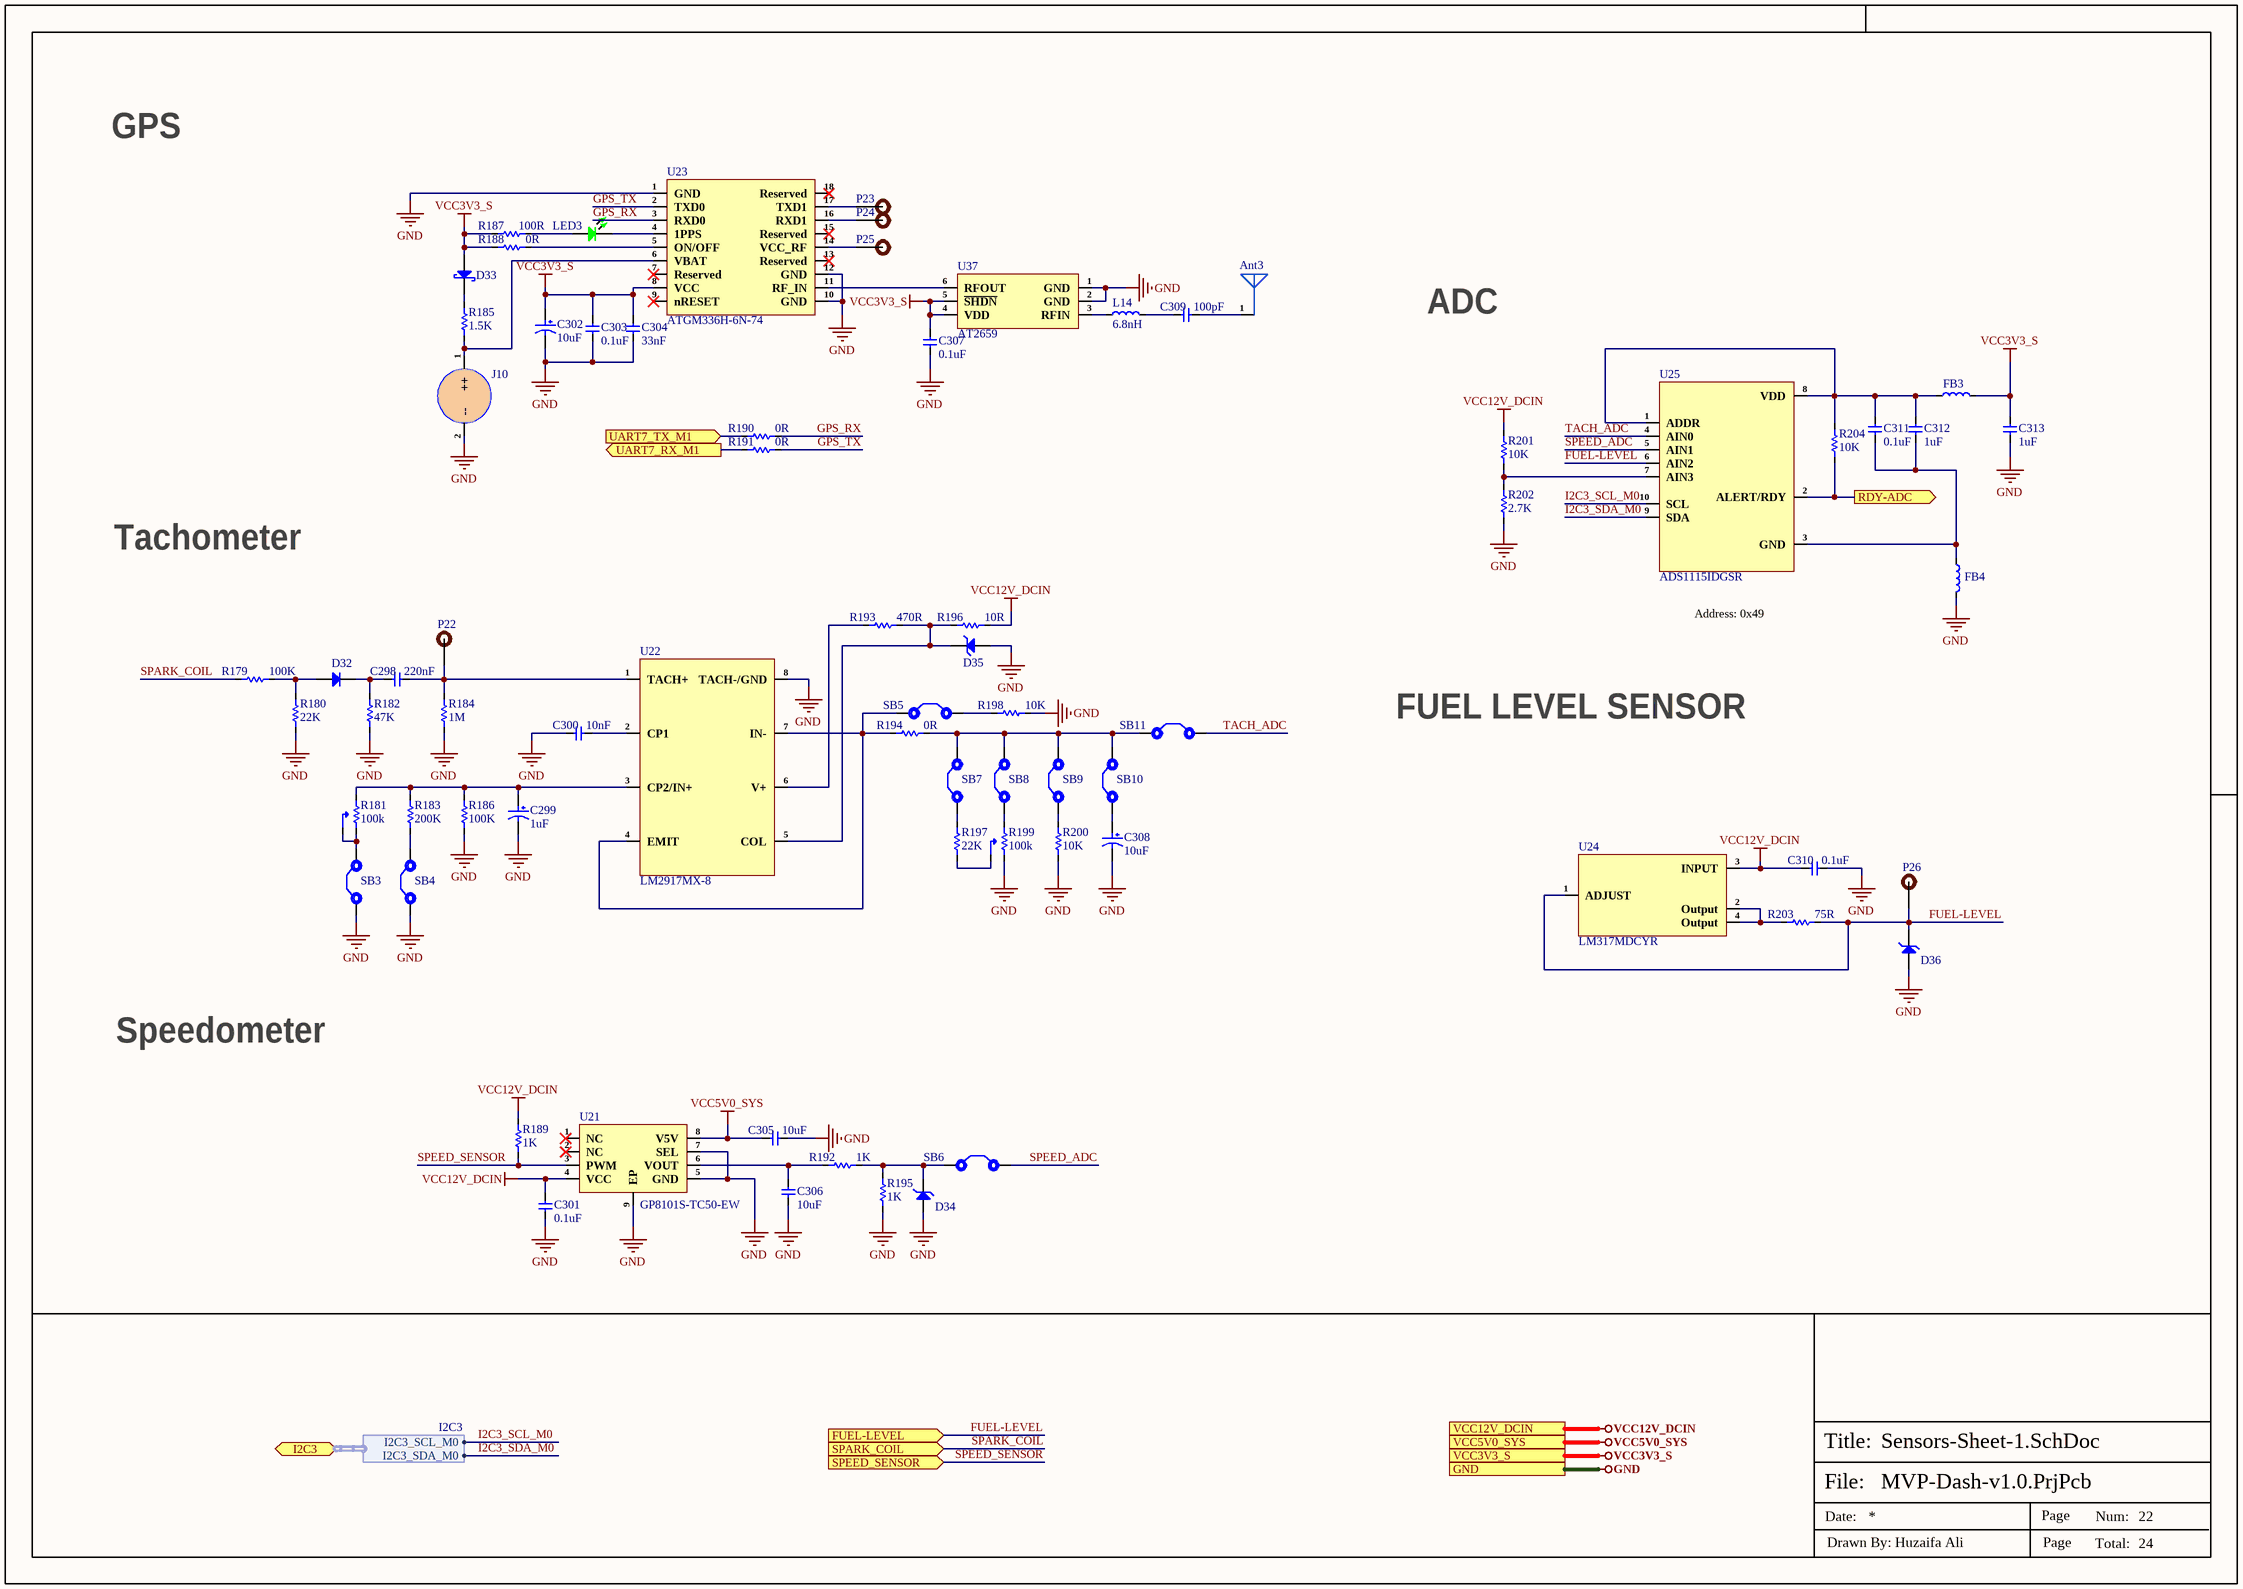
[diagram p30: Sensors-Sheet-1.SchDoc]

### Parts
Ant3  KH-GPS181804-WY  [KH-GPS181804-WY]  (value not drawn)
C298  220nF  [Cap-1210]
C299  1uF  [RVT1H1R0M0405]
C300  10nF  [Cap-0805]
C301  0.1uF  [Cap-0402]
C302  10uF  [RVT1E100M0405_]
C303  0.1uF  [Cap-0402]
C304  33nF  [Cap-0402]
C305  10uF  [Cap-0805]
C306  10uF  [Cap-0805]
C307  0.1uF  [Cap-0402]
C308  10uF  [50SVPF10M]
C309  100pF  [Cap-0603]
C310  0.1uF  [Cap-0402]
C311  0.1uF  [Cap-0402]
C312  1uF  [Cap-0402]
C313  1uF  [Cap-0402]
D32  1N4007- SMD  [SMA(DO-214AC)]  (value not drawn)
D33  B5819WS  [SOD-323]  (value not drawn)
D34  PESDHC3D3V3U  [SOD-323]  (value not drawn)
D35  BZT52C16  [SOD-123]  (value not drawn)
D36  MSP3V3HM3/89A  [MicroSMP]  (value not drawn)
FB3  MMZ2012R102ATD25  [Ind-0805]  (value not drawn)
FB4  MMZ2012R102ATD25  [Ind-0805]  (value not drawn)
J10  PB-621SR13-TF  [PB-621SR13-TF]  (value not drawn)
L14  6.8nH  [Ind-0805]
LED3  Emerald  [LED-0603]  (value not drawn)
P22  TEST POINT 0.5mm Dia  [Test-point - 0.5mm]  (value not drawn)  (no BOM)
P23  TEST POINT 0.5mm Dia  [Test-point - 0.5mm]  (value not drawn)  (no BOM)
P24  TEST POINT 0.5mm Dia  [Test-point - 0.5mm]  (value not drawn)  (no BOM)
P25  TEST POINT 0.5mm Dia  [Test-point - 0.5mm]  (value not drawn)  (no BOM)
P26  TEST POINT 0.5mm Dia  [Test-point - 0.5mm]  (value not drawn)  (no BOM)
R179  100K  [RES-0805]
R180  22K  [Res-0603]
R181  100k  [TC33X-2-104E_]
R182  47K  [Res-0603]
R183  200K  [Res-0402]
R184  1M  [RES-0805]
R185  1.5K  [Res-0402]
R186  100K  [Res-0402]
R187  100R  [Res-0402]
R188  0R  [Res-0402]
R189  1K  [Res-0402]
R190  0R  [Res-0402]
R191  0R  [Res-0402]
R192  1K  [Res-0603]
R193  470R  [Res-0603]
R194  0R  [Res-0805]
R195  1K  [Res-0603]
R196  10R  [Res-0603]
R197  22K  [Res-0603]
R198  10K  [Res-0402]
R199  100k  [TC33X-2-104E_]
R200  10K  [Res-0402]
R201  10K  [Res-0603]
R202  2.7K  [Res-0603]
R203  75R  [Res-0603]
R204  10K  [Res-0402]
SB3  Solder Bridge 0603  [Solder Bridge]  (value not drawn)  (no BOM)
SB4  Solder Bridge 0603  [Solder Bridge]  (value not drawn)  (no BOM)
SB5  Solder Bridge 0603  [Solder Bridge]  (value not drawn)  (no BOM)
SB6  Solder Bridge 0603  [Solder Bridge]  (value not drawn)  (no BOM)
SB7  Solder Bridge 0603  [Solder Bridge]  (value not drawn)  (no BOM)
SB8  Solder Bridge 0603  [Solder Bridge]  (value not drawn)  (no BOM)
SB9  Solder Bridge 0603  [Solder Bridge]  (value not drawn)  (no BOM)
SB10  Solder Bridge 0603  [Solder Bridge]  (value not drawn)  (no BOM)
SB11  Solder Bridge 0603  [Solder Bridge]  (value not drawn)  (no BOM)
U21  GP8101S-TC50-EW  [ESOP-8]
U22  LM2917MX-8  [SOIC-8(0.154", 3.90mm Width)]
U23  ATGM336H-6N-74  [ATGM336H-6N-74]
U24  LM317MDCYR  [SOT- 223]
U25  ADS1115IDGSR  [VSSOP-10]
U37  AT2659  [DFN-6(1x1.6)]

### Ports
FUEL-LEVEL (in, see Connector-Sheet[1D]), GND (see CAN-Bus-SPI-Flash-Sheet[4D], Connector-Sheet[5D], DRAM-LPDDR4x-Sheet[4D], eMMC-Sheet[4D], LED-Debug-Sheet[4D], Power-DC-IN-Sheet[4D], Power-Others-Sheet[4D], Power-PMIC-Sheet[4D], RK3568-Audio-Interface[4D], RK3568-Flash-SD-Controller[4D], RK3568-OSC-PMUIO-Sheet[5D], RK3568-Power-Sheet[4D], RK3568-SARADC-GPIO[4D], RK3568-USB-PCIe-Sheet[5D], RK3568-VI-Interface-Sheet[4D], RK3568-VO-Interface-1[4D], RK3568-VO-Interface-2[4D], Sensors-Sheet-2[5D], Type-C-Sheet[4D], USB-Ports[4D], VO-LCM-MIPI-DSI-TX0[4D], WIFI-BT-SDIO-Sheet[4D]), I2C3 (bidir, harness I2C3, see RK3568-Audio-Interface[3D], Sensors-Sheet-2[4D]), RDY-ADC (out, see RK3568-OSC-PMUIO-Sheet[5B]), SPARK_COIL (in, see Connector-Sheet[1D]), SPEED_SENSOR (in, see Connector-Sheet[1D]), UART7_RX_M1 (out, see RK3568-VO-Interface-2[3C]), UART7_TX_M1 (in, see RK3568-VO-Interface-2[3C]), VCC3V3_S (see LED-Debug-Sheet[4D], Power-DC-IN-Sheet[4D], Sensors-Sheet-2[5D], Type-C-Sheet[4D], VO-LCM-MIPI-DSI-TX0[4D], WIFI-BT-SDIO-Sheet[4D]), VCC5V0_SYS (see Power-DC-IN-Sheet[4D], Power-Others-Sheet[4D], Power-PMIC-Sheet[4D], VO-LCM-MIPI-DSI-TX0[4D]), VCC12V_DCIN (see Connector-Sheet[5D], Power-DC-IN-Sheet[4D], Sensors-Sheet-2[5D])

### Harnesses
I2C3: I2C3_SCL_M0, I2C3_SDA_M0

### Nets
GND: C299.2 C300.1 C301.1 C302.2 C303.1 C304.1 C305.1 C306.2 C307.1 C308.2 C310.1 C313.2 D34.2(A) D35.1(A) D36.1(A) FB4.2 J10.2(--) R180.1 R182.1 R184.1 R186.1 R195.1 R198.2 R199.1(CCW) R200.1 R202.1 SB3.1 SB4.1 U21.5(GND) U21.7(SEL) U21.9(EP) U22.8(TACH-/GND) U23.1(GND) U23.10(GND) U23.12(GND) U37.1(GND) U37.2(GND) ; port GND
VCC3V3_S: C302.1 C303.2 C304.2 C307.2 C313.1 D33.2(A) FB3.2 R187.1 R188.1 U23.8(VCC) U37.4(VDD) U37.5(~{SH}~{DN}) ; port VCC3V3_S
VCC5V0_SYS: C305.2 U21.8(V5V) ; port VCC5V0_SYS
VCC12V_DCIN: C301.2 C310.2 R189.2 R196.2 R201.2 U21.4(VCC) U24.3(INPUT) ; port VCC12V_DCIN
FUEL-LEVEL: D36.2(K) P26.1 R203.2 U24.1(ADJUST) U25.6(AIN2) ; port FUEL-LEVEL
GPS_RX: R190.2 U23.3(RXD0)
GPS_TX: R191.2 U23.2(TXD0)
I2C3_SCL_M0: U25.10(SCL) ; port I2C3.I2C3_SCL_M0
I2C3_SDA_M0: U25.9(SDA) ; port I2C3.I2C3_SDA_M0
SPARK_COIL: R179.1 ; port SPARK_COIL
SPEED_ADC: SB6.2 U25.5(AIN1)
SPEED_SENSOR: R189.1 U21.3(PWM) ; port SPEED_SENSOR
TACH_ADC: SB11.2 U25.4(AIN0)
NetAnt3_1: Ant3.1 C309.2
NetC298_1: C298.1 P22.1 R184.2 U22.1(TACH+)
NetC298_2: C298.2 D32.1(K) R182.2
NetC299_1: C299.1 R181.3(CW) R183.2 R186.2 U22.3(CP2/IN+)
NetC300_2: C300.2 U22.2(CP1)
NetC306_1: C306.1 R192.1 U21.6(VOUT)
NetC308_1: C308.1 SB10.1
NetC309_1: C309.1 L14.2
NetC311_1: C311.1 C312.1 FB3.1 R204.2 U25.1(ADDR) U25.8(VDD)
NetC311_2: C311.2 C312.2 FB4.1 U25.3(GND)
NetD32_2: D32.2(A) R179.2 R180.2
NetD33_1: D33.1(K) R185.2
NetD34_1: D34.1(C) R192.2 R195.2 SB6.1
NetD35_2: D35.2(K) R193.2 R196.1 U22.5(COL)
NetJ10_1: J10.1(++) R185.1 U23.6(VBAT)
NetL14_1: L14.1 U37.3(RFIN)
NetLED3_1: LED3.1 R187.2
NetLED3_2: LED3.2 U23.4(1PPS)
NetP23_1: P23.1 U23.17(TXD1)
NetP24_1: P24.1 U23.16(RXD1)
NetP25_1: P25.1 U23.14(VCC_RF)
NetR181_1: R181.1(CCW) R181.2(Wiper) SB3.2
NetR183_1: R183.1 SB4.2
NetR188_2: R188.2 U23.5(ON/OFF)
NetR190_1: R190.1 ; port UART7_TX_M1
NetR191_1: R191.1 ; port UART7_RX_M1
NetR193_1: R193.1 U22.6(V+)
NetR194_1: R194.1 SB5.1 U22.4(EMIT) U22.7(IN-)
NetR194_2: R194.2 SB7.2 SB8.2 SB9.2 SB10.2 SB11.1
NetR197_1: R197.1 R199.2(Wiper)
NetR197_2: R197.2 SB7.1
NetR198_1: R198.1 SB5.2
NetR199_3: R199.3(CW) SB8.1
NetR200_2: R200.2 SB9.1
NetR201_1: R201.1 R202.2 U25.7(AIN3)
NetR203_1: R203.1 U24.2(Output) U24.4(Output)
NetR204_1: R204.1 U25.2(ALERT/RDY) ; port RDY-ADC
NetU23_11: U23.11(RF_IN) U37.6(RFOUT)

Not connected (* = marked no-connect by the designer): U21 1(NC)* 2(NC)*; U23 7(Reserved)* 9(nRESET)* 13(Reserved)* 15(Reserved)* 18(Reserved)*

### Notes on the sheet
- GPS
- ADC
- Tachometer
- Address: 0x49
- FUEL LEVEL SENSOR
- Speedometer
- File:
- Title:
- Date:
- Page
- Num:
- Total:
- Drawn By: Huzaifa Ali